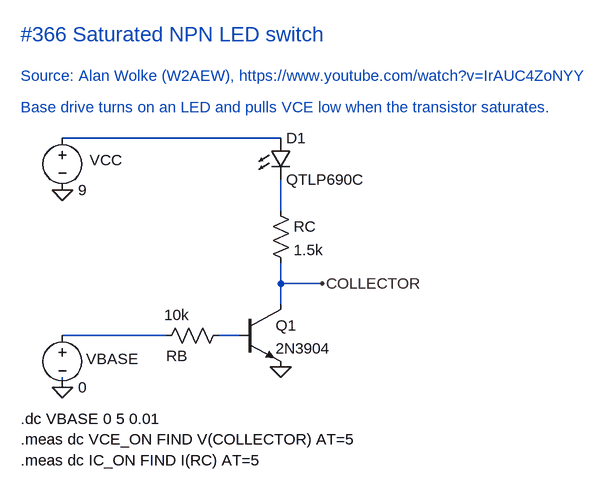
[diagram p0: schematic LED transistor switch.asc]
LED transistor switch.asc, the LTspice schematic file:
Version 4.1
SHEET 1 1000 800
WIRE 432 192 96 192
WIRE 432 304 432 256
WIRE 432 416 432 384
WIRE 496 416 432 416
WIRE 432 448 432 416
WIRE 256 496 96 496
WIRE 368 496 336 496
WIRE 96 576 96 560
FLAG 96 576 0
FLAG 432 544 0
FLAG 96 272 0
FLAG 496 416 COLLECTOR
SYMBOL voltage 96 480 R0
WINDOW 0 37 52 Left 2
SYMATTR InstName VBASE
SYMATTR Value 0
SYMBOL res 240 512 R270
WINDOW 0 0 32 VBottom 2
WINDOW 3 32 32 VTop 2
SYMATTR InstName RB
SYMATTR Value 10k
SYMBOL npn 368 448 R0
SYMATTR InstName Q1
SYMATTR Value 2N3904
SYMBOL LED 416 192 R0
SYMATTR InstName D1
SYMATTR Value QTLP690C
SYMBOL res 416 288 R0
SYMATTR InstName RC
SYMATTR Value 1.5k
SYMBOL voltage 96 176 R0
WINDOW 0 42 50 Left 2
SYMATTR InstName VCC
SYMATTR Value 9
TEXT 32 32 Left 3 ;#366 Saturated NPN LED switch
TEXT 32 96 Left 2 ;Source: Alan Wolke (W2AEW), https://www.youtube.com/watch?v=IrAUC4ZoNYY
TEXT 32 144 Left 2 ;Base drive turns on an LED and pulls VCE low when the transistor saturates.
TEXT 32 624 Left 2 !.dc VBASE 0 5 0.01
TEXT 32 656 Left 2 !.meas dc VCE_ON FIND V(COLLECTOR) AT=5
TEXT 32 688 Left 2 !.meas dc IC_ON FIND I(RC) AT=5

The netlist it stands for:
* LED transistor switch.asc
VBASE N003 0 0
RB N003 N004 10k
Q1 COLLECTOR N004 0 0 2N3904
D1 N001 N002 QTLP690C
RC N002 COLLECTOR 1.5k
VCC N001 0 9
.model D D
.lib standard.dio
.model NPN NPN
.model PNP PNP
.lib standard.bjt
* #366 Saturated NPN LED switch
* Source: Alan Wolke (W2AEW), https://www.youtube.com/watch?v=IrAUC4ZoNYY
* Base drive turns on an LED and pulls VCE low when the transistor saturates.
.dc VBASE 0 5 0.01
.meas dc VCE_ON FIND V(COLLECTOR) AT=5
.meas dc IC_ON FIND I(RC) AT=5
.backanno
.end